# Altium schematic sheet PCAP01模块原理图.schdoc
size 181 x 162 mm
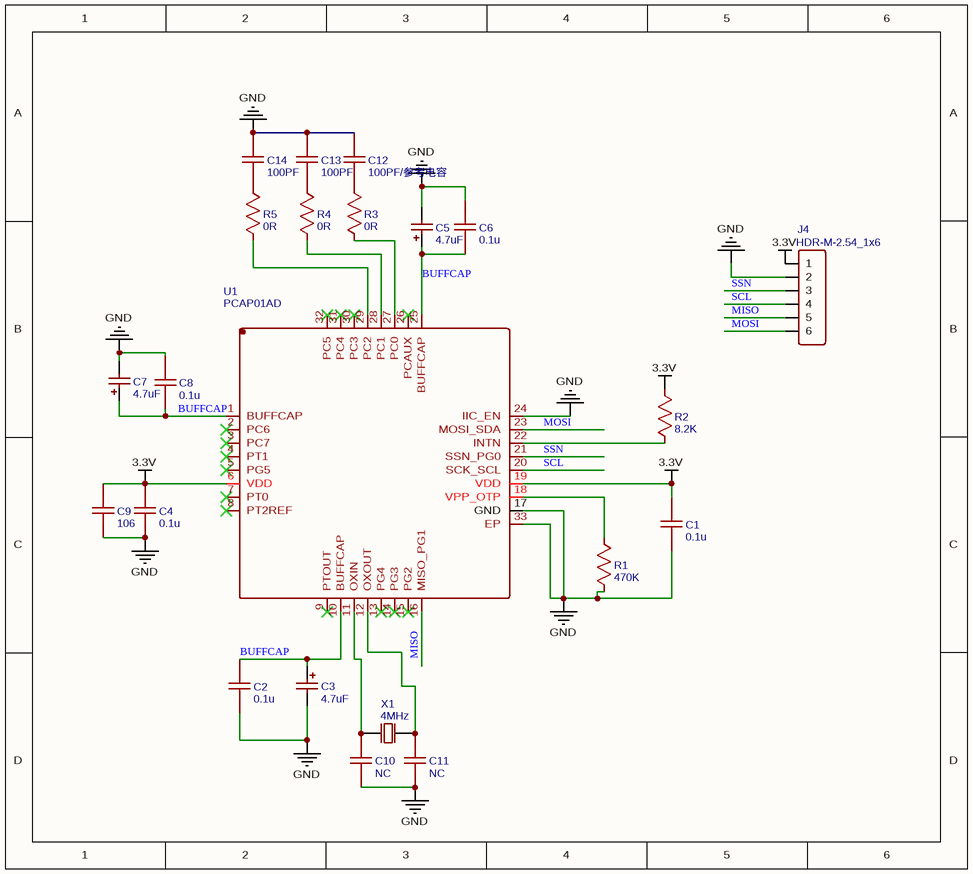
[diagram p0: PCAP01模块原理图.schdoc]

## Parts
C1  0.1u  [C0805]
C2  0.1u  [C0805]
C3  4.7uF  [CASE-A_3216]
C4  0.1u  [C0805]
C5  4.7uF  [CASE-A_3216]
C6  0.1u  [C0805]
C7  4.7uF  [CASE-A_3216]
C8  0.1u  [C0805]
C9  106  [C0805]
C10  NC  [C0805]
C11  NC  [C0805]
C12  100PF/参考电容  [C0805]
C13  100PF  [C0805]
C14  100PF  [C0805]
J4  HDR-M-2.54_1x6  [HDR-M-2.54_1X6]
R1  470K  [R0805]
R2  8.2K  [R0805]
R3  0R  [R0805]
R4  0R  [R0805]
R5  0R  [R0805]
U1  PCAP01AD  [VQFN-32_L5.0-W5.0-P0.50-TL-EP]
X1  4MHz  [HC-49S_L11.4-W4.8]

## Nets
3.3V: C1.2 C4.2 C9.2 J4.1 R2.2 U1.6(VDD) U1.19(VDD)
GND: C1.1 C2.1 C3.2 C4.1 C5.2 C6.1 C7.2 C8.1 C9.1 C10.1 C11.1 C12.2 C13.2 C14.2 J4.2 R1.1 U1.17(GND) U1.24(IIC_EN) U1.33(EP)
BUFFCAP: C2.2 C3.1 C5.1 C6.2 C7.1 C8.2 U1.1(BUFFCAP) U1.10(BUFFCAP) U1.25(BUFFCAP)
MISO: J4.5 U1.16(MISO_PG1)
MOSI: J4.6 U1.23(MOSI_SDA)
SCL: J4.4 U1.20(SCK_SCL)
SSN: J4.3 U1.21(SSN_PG0)
NetC10_2: C10.2 U1.11(OXIN) X1.1(OSC1)
NetC11_2: C11.2 U1.12(OXOUT) X1.2(OSC2)
NetC12_1: C12.1 R3.2
NetC13_1: C13.1 R4.2
NetC14_1: C14.1 R5.2
NetR1_2: R1.2 U1.18(VPP_OTP)
NetR2_1: R2.1 U1.22(INTN)
NetR3_1: R3.1 U1.27(PC0)
NetR4_1: R4.1 U1.28(PC1)
NetR5_1: R5.1 U1.29(PC2)

Not connected (* = marked no-connect by the designer): U1 2(PC6)* 3(PC7)* 4(PT1)* 5(PG5)* 7(PT0)* 8(PT2REF)* 9(PTOUT)* 13(PG4)* 14(PG3)* 15(PG2)* 26(PCAUX)* 30(PC3)* 31(PC4)* 32(PC5)*

## Library data of the parts
C1 C2 C4 C6 C8 C12-C14 = 0.1u: nameAlias: Value(F); Contributor: LCEDA_Lib; spicePre: C; spiceSymbolName: C_0805_US
C3 C5 C7 = 4.7uF: BOM_Manufacturer: Sunlord(顺络); BOM_Manufacturer Part: TC212A106M010Y; nameAlias: Capacitance; BOM_Supplier: LCSC; BOM_Supplier Part: C132749; BOM_JLCPCB Part Class: Extended Part; spicePre: C; spiceSymbolName: TC212A106M010Y
C9 = 106: nameAlias: Value(F); Contributor: LCEDA_Lib; spicePre: C; spiceSymbolName: C_0805_US
C10 C11 = NC: nameAlias: Value(F); Contributor: LCEDA_Lib; spicePre: C; spiceSymbolName: C_0805_US
J4 = HDR-M-2.54_1x6: Contributor: LCEDA_Lib; BOM_Supplier Part: C190819; BOM_Supplier: LCSC; spicePre: J; spiceSymbolName: HDR-M-2.54_1x6
R1 = 470K: nameAlias: Value(Ω); Contributor: LCEDA_Lib; spicePre: R; spiceSymbolName: R_0805_US
R2-R5 = 8.2K: nameAlias: Value(Ω); Contributor: LCEDA_Lib; spicePre: R; spiceSymbolName: R_0805_US
U1 = PCAP01AD: BOM_Manufacturer: ams(艾迈斯半导体); Contributor: LCSC; BOM_Supplier: LCSC; BOM_Supplier Part: C192738; BOM_Manufacturer Part: PCAP01AD; BOM_JLCPCB Part Class: Extended Part; spicePre: U; spiceSymbolName: PCAP01AD
X1 = 4MHz: BOM_Manufacturer: TAE(雅晶鑫); BOM_Manufacturer Part: TAXM4M2ILFBET2T; nameAlias: Frequency; Contributor: LCSC; BOM_Supplier: LCSC; BOM_Supplier Part: C362474; BOM_JLCPCB Part Class: Extended Part; spicePre: X; spiceSymbolName: HC-49SM 4MHz 20pF 30PPM